# Altium schematic sheet Sensors.SchDoc: Sensors
size A3; SheetNumber: 3; SheetTotal: 4
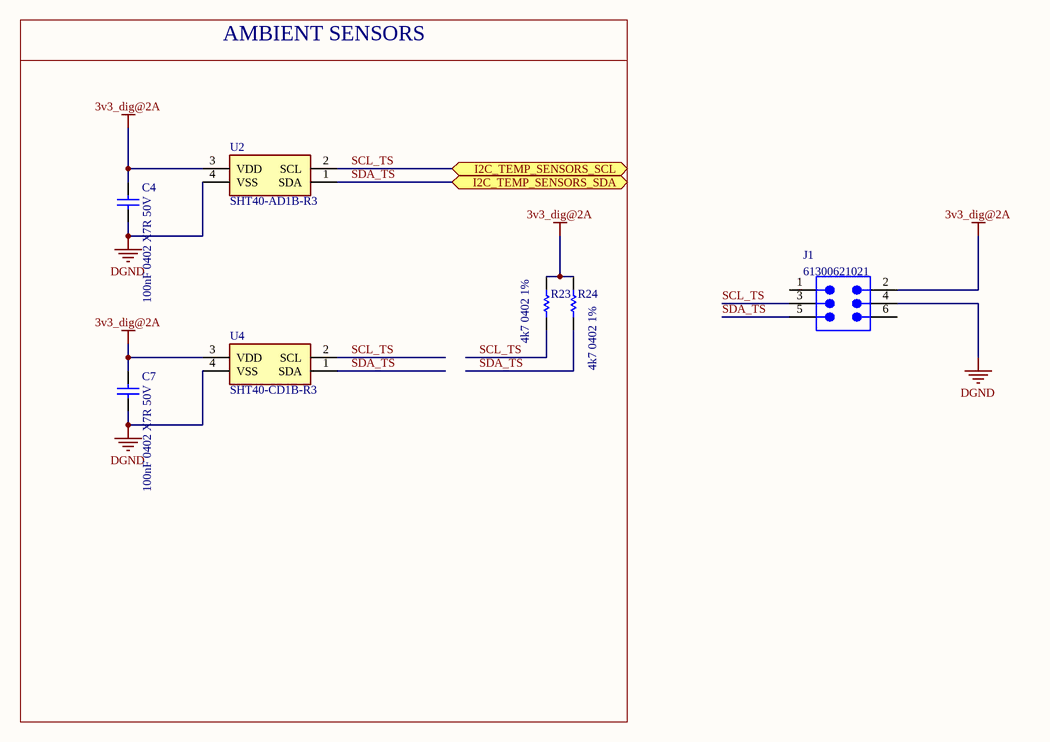
[diagram p0: Sensors.SchDoc]

## Parts
C4  100nF 0402 X7R 50V  [CAPC1005X55X25NL5T10]
C7  100nF 0402 X7R 50V  [CAPC1005X55X25NL5T10]
J1  61300621021  [61300621021]
R23  4k7 0402 1%  [RESC1005X40X25ML05T10]
R24  4k7 0402 1%  [RESC1005X40X25ML05T10]
U2  SHT40-AD1B-R3  [SHT40AD1BR3]
U4  SHT40-CD1B-R3  [SHT40CD1BR3]

## Blocks framed on the sheet
AMBIENT SENSORS: C4 C7 R23 R24 U2 U4

## Ports
I2C_TEMP_SENSORS_SCL (bidir), I2C_TEMP_SENSORS_SDA (bidir)

## Nets
3v3_dig@2A: C4.2 C7.2 J1.2 R23.1 R24.1 U2.3(VDD) U4.3(VDD)
DGND: C4.1 C7.1 J1.4 U2.4(VSS) U4.4(VSS)
SCL_TS: J1.3 R23.2 U2.2(SCL) U4.2(SCL) ; port I2C_TEMP_SENSORS_SCL
SDA_TS: J1.5 R24.2 U2.1(SDA) U4.1(SDA) ; port I2C_TEMP_SENSORS_SDA

Not connected (* = marked no-connect by the designer): J1 1 6

## Notes on the sheet
- Title
- Size:
- Date:
- A3
- Author:
- Time:
- Revision:
- Sheet
- of
- File:

## Library data of the parts
C4 C7 = CMP-1662-00020-1: ComponentLink2Description: Datasheet; ComponentLink2URL: http://psearch.en.murata.com/capacitor/product/GRM155R60J105KE19%23.pdf; ComponentLink1Description: Manufacturer URL; ComponentLink1URL: http://www.murata.com/; LCSC_PN: C77020
J1 = CMP-1502-01071-5: THT Angled Pin Header WR-PHD, Pitch 2.54 mm, Dual Row, 6 pins; Pitch: 2.54mm; Number of Positions: 6; Current Rating: 3A; Gender: Male; Contact Resistance: 20mΩ; Connector Type: Male Pin; Operating Supply Voltage: 250V; Mount: Through Hole; Number of Pins: 6; Row Spacing: 2.54mm; Number of Rows: 2; Max Operating Temperature: 105°C; RoHS: Compliant; Contact Material: Gold; Height: 5.23mm; Contact Mating Length: 5.9944mm; Color: Black; Min Operating Temperature: -40°C; Termination: Solder; Contact Plating: Gold; Number of Contacts: 6; Lead Pitch: 2.54mm; Packaging: Bulk; Voltage Rating: 250V; LCSC_PN: C239334
R23 R24 = CMP-2002-07472-1: LCSC_PN: C105871
U2 = SHT40-AD1B-R3: Integrated Circuit; Manufacturer_Name: Sensirion; Datasheet Link: https://www.arrow.com/en/products/sht40-ad1b-r3/sensirion-ag; Height: 0.59mm; Manufacturer_Part_Number: SHT40-AD1B-R3; Mouser Part Number: 403-SHT40-AD1B-R3; Mouser Price/Stock: https://www.mouser.co.uk/ProductDetail/Sensirion/SHT40-AD1B-R3?qs=zW32dvEIR3sa7U6cFW6pBw%3D%3D; Arrow Part Number: SHT40-AD1B-R3; Arrow Price/Stock: https://www.arrow.com/en/products/sht40-ad1b-r3/sensirion-ag?utm_currency=USD&region=asia; LCSC_PN: C2848306
U4 = SHT40-CD1B-R3: Integrated Circuit; Manufacturer_Name: Sensirion; Datasheet Link: https://sensirion.com/media/documents/33FD6951/6555C40E/Sensirion_Datasheet_SHT4x.pdf; Height: 0.59mm; Manufacturer_Part_Number: SHT40-CD1B-R3; Mouser Part Number: 403-SHT40-CD1B-R3; Mouser Price/Stock: https://www.mouser.co.uk/ProductDetail/Sensirion/SHT40-CD1B-R3?qs=ulEaXIWI0c%2FeyXO6eo5KrQ%3D%3D; Arrow Part Number: SHT40-CD1B-R3; Arrow Price/Stock: https://www.arrow.com/en/products/sht40-cd1b-r3/sensirion-ag?utm_currency=USD&region=nac; LCSC_PN: C7461852